# EAGLE schematic tpms_schema (EAGLE 9.6.2)
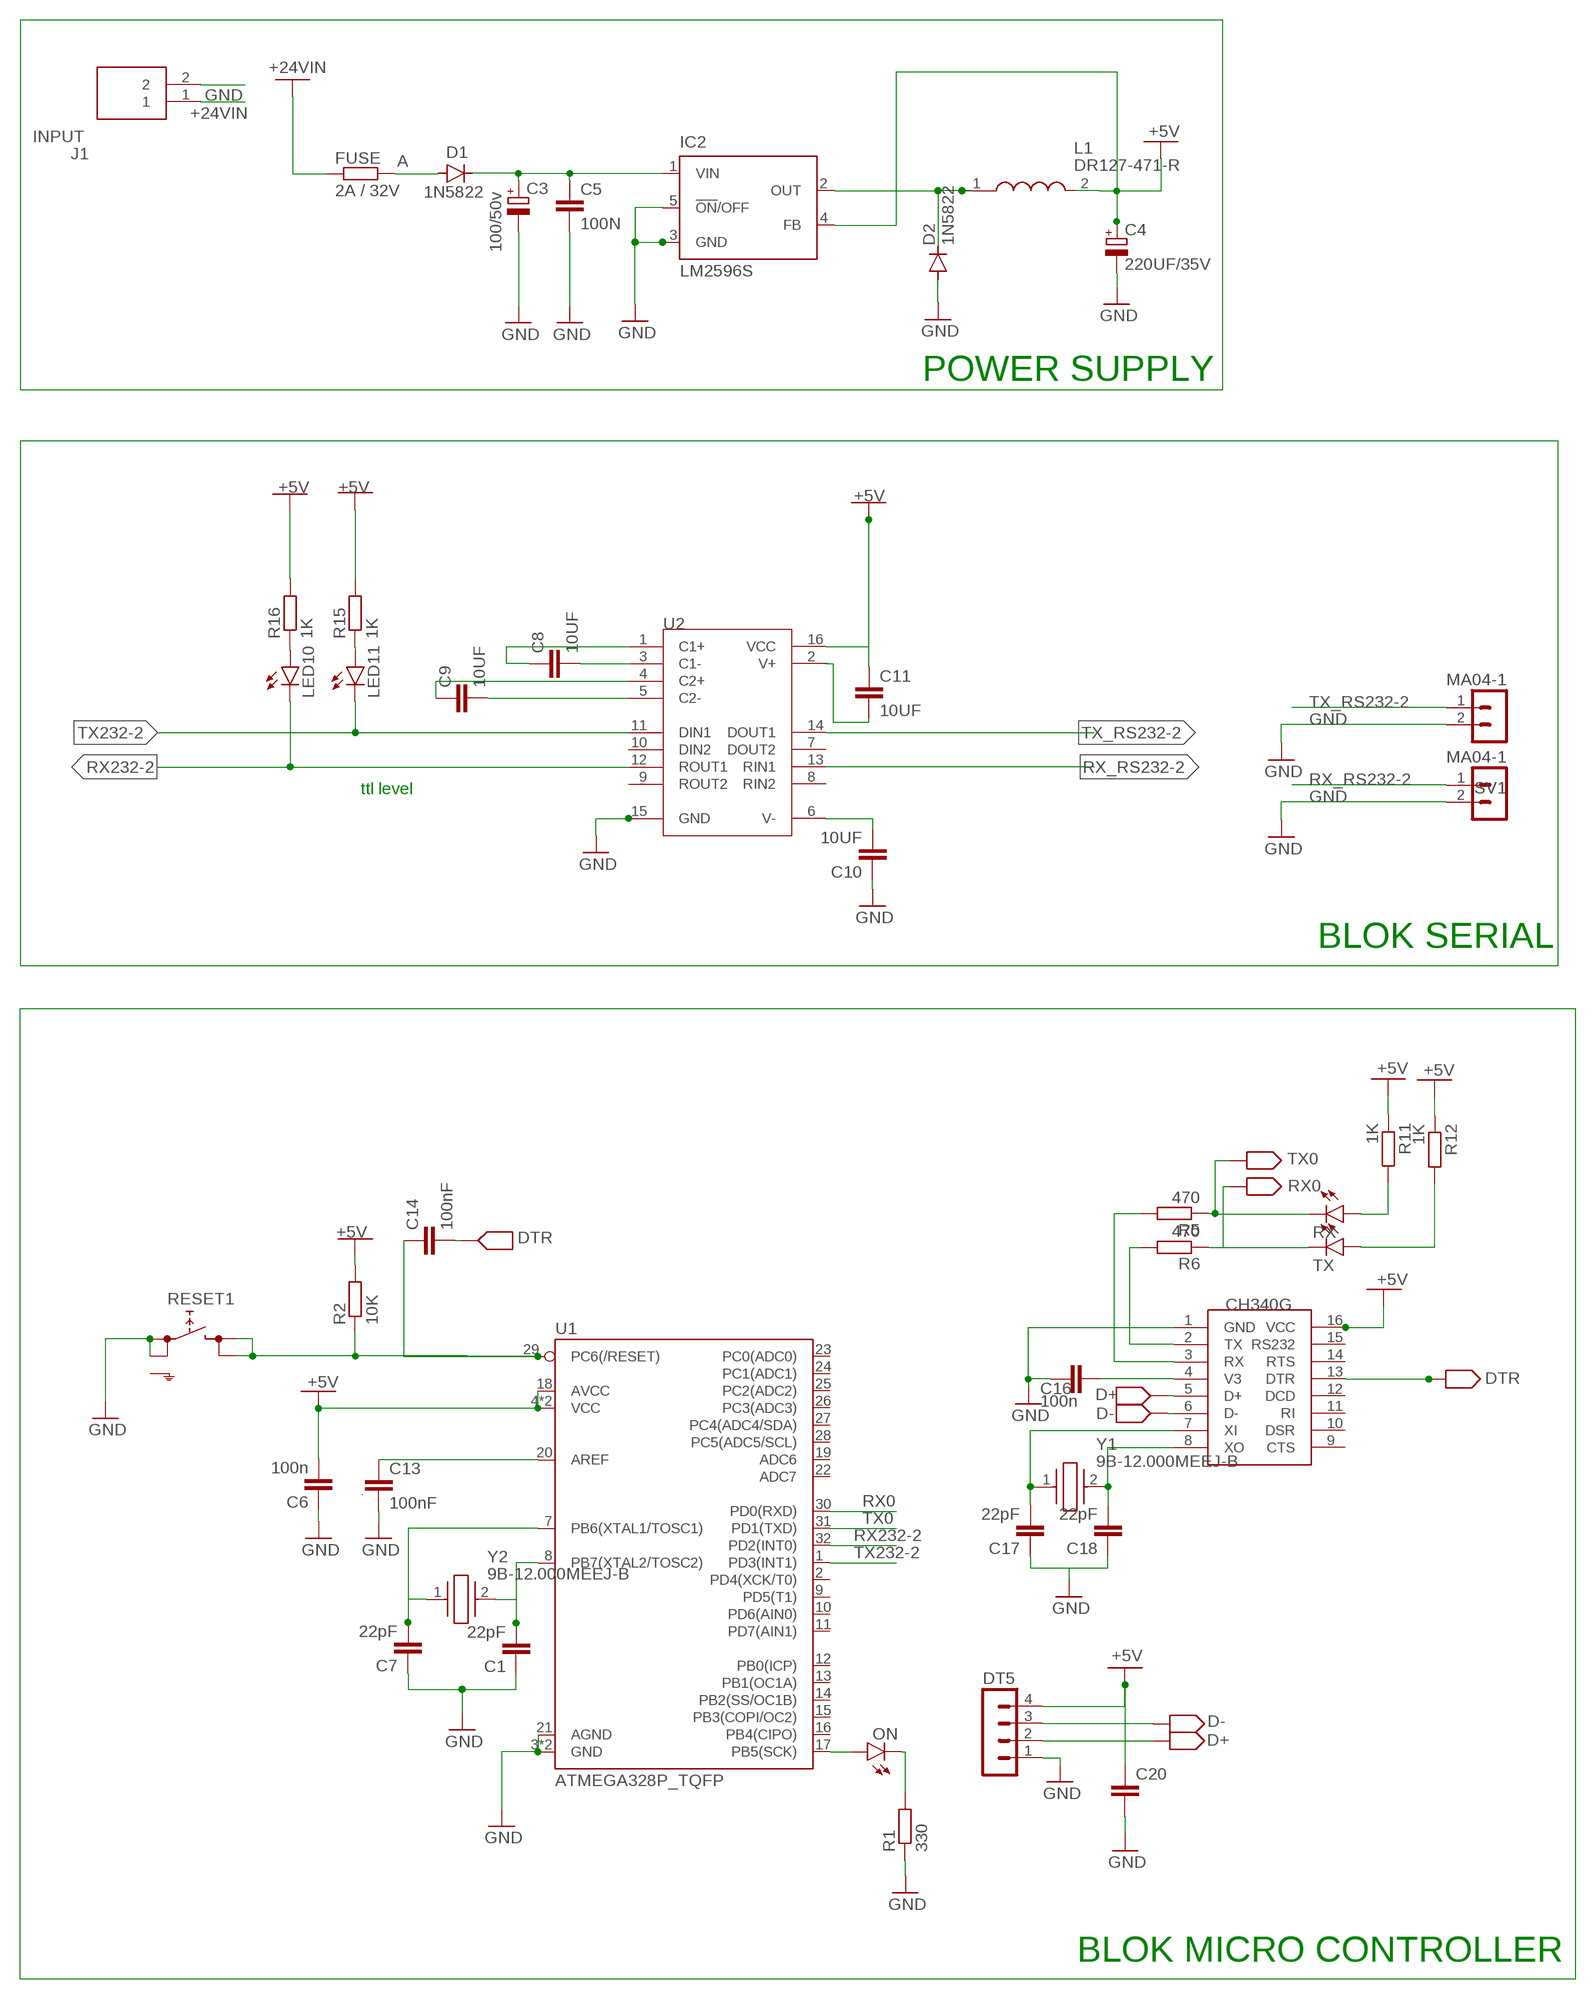
[diagram p0: schematic, sheet 1]

## Parts
C1  22pF  C-EUC0805  [C0805]
C3  100/50v  CPOL-EUG  [PANASONIC_G]
C4  220UF/35V  CPOL-EUG  [PANASONIC_G]
C5  100N  C-EUC0805  [C0805]
C6  100n  C-EUC0805  [C0805]
C7  22pF  C-EUC0805  [C0805]
C8  10UF  C-EUC0805  [C0805]
C9  10UF  C-EUC0805  [C0805]
C10  10UF  C-EUC0805  [C0805]
C11  10UF  C-EUC0805  [C0805]
C13  100nF  C-EUC0805  [C0805]
C14  100nF  C-EUC0805  [C0805]
C16  100n  C-EUC0805  [C0805]
C17  22pF  C-EUC0805  [C0805]
C18  22pF  C-EUC0805  [C0805]
C20  1uF  C-EUC0805  [C0805]
D1  1N5822  DIODE-MELF-MLL41  [MELF-MLL41]
D2  1N5822  DIODE-MELF-MLL41  [MELF-MLL41]
DT5  MA04-1  [MA04-1]
FUSE  2A / 32V  R-EU_R1206  [R1206]
IC2  LM2596S  [TO263-5]
J1  INPUT  691305330002  [691305330002]
L1  DR127-471-R  [INDPM125125X800N]
LED10  LEDCHIPLED_0805  [CHIPLED_0805]
LED11  LEDCHIPLED_0805  [CHIPLED_0805]
ON  LEDCHIP-LED0805  [CHIP-LED0805]
R1  330  R-EU_R0805  [R0805]
R2  10K  R-EU_R0805  [R0805]
R5  470  R-EU_R0805  [R0805]
R6  470  R-EU_R0805  [R0805]
R11  1K  R-EU_R0805  [R0805]
R12  1K  R-EU_R0805  [R0805]
R15  1K  R-EU_R0805  [R0805]
R16  1K  R-EU_R0805  [R0805]
RESET1  SKHMPSE010  [SKHMPXE010]
RX  LEDCHIP-LED0805  [CHIP-LED0805]
SV1  MA04-1  [MA04-1]
SV2  MA04-1  [MA04-1]
TX  LEDCHIP-LED0805  [CHIP-LED0805]
U1  ATMEGA328P_TQFP  [TQFP32-08]
U2  RF-MAX232D  [SOIC16-1.27-10X3.9MM]
U$1  CH340G  [SOIC16]
Y1  9B-12.000MEEJ-B  [9B12000MEEJB]
Y2  9B-12.000MEEJ-B  [9B12000MEEJB]

## Nets
+5V: C4.+ C6.2 C11.1 C20.1 DT5.4 IC2.4(FB) L1.2 R2.2 R11.1 R12.1 R15.2 R16.2 U1.4(VCC) U1.6(VCC) U1.18(AVCC) U2.16(VCC) U$1.16(VCC) ; supply symbol labelled -12V
+24VIN: FUSE.1 J1.1 ; supply symbol labelled -12V
A: D1.A FUSE.2
D+: DT5.2 U$1.5(D+) ; supply symbol labelled PORT_IN2, PORT_OUT2
D-: DT5.3 U$1.6(D-) ; supply symbol labelled PORT_IN2, PORT_OUT2
DTR: C14.2 U$1.13(DTR) ; supply symbol labelled PORT_OUT2, PORT_IN2
GND: C1.1 C3.- C4.- C5.2 C6.1 C7.1 C10.1 C13.2 C16.1 C17.1 C18.1 C20.2 D2.A DT5.1 IC2.3(GND) IC2.5(!ON!/OFF) J1.2 R1.1 RESET1.1(1.1) RESET1.2(1.2) SV1.2 SV2.2 U1.3(GND) U1.5(GND) U1.21(AGND) U2.15(GND) U$1.1(GND)
N$1: C9.2 U2.5(C2-)
N$2: C9.1 U2.4(C2+)
N$3: ON.A U1.17(PB5(SCK))
N$4: ON.C R1.2
N$5: C13.1 U1.20(AREF)
N$6: R11.2 RX.A
N$7: R12.2 TX.A
N$8: C16.2 U$1.4(V3)
N$10: C17.2 U$1.7(XI) Y1.1
N$11: C18.2 U$1.8(XO) Y1.2
N$13: R5.2 U$1.3(RX)
N$14: R6.2 U$1.2(TX)
N$16: LED10.A R16.1
N$18: C8.2 U2.3(C1-)
N$19: C8.1 U2.1(C1+)
N$21: D2.C IC2.2(OUT) L1.1
N$23: LED11.A R15.1
N$24: C10.2 U2.6(V-)
N$25: C11.2 U2.2(V+)
N$40: C3.+ C5.1 D1.C IC2.1(VIN)
PB6: C7.2 U1.7(PB6(XTAL1/TOSC1)) Y2.1
PB7: C1.2 U1.8(PB7(XTAL2/TOSC2)) Y2.2
RESET: C14.1 R2.1 RESET1.3(2.1) RESET1.4(2.2) U1.29(PC6(/RESET))
RX0: R6.1 TX.C U1.30(PD0(RXD)) ; supply symbol labelled PORT_OUT2
RX232-2: LED10.C U1.32(PD2(INT0)) U2.12(ROUT1)
RX_RS232-2: SV2.1 U2.13(RIN1)
TX0: R5.1 RX.C U1.31(PD1(TXD)) ; supply symbol labelled PORT_OUT2
TX232-2: LED11.C U1.1(PD3(INT1)) U2.11(DIN1)
TX_RS232-2: SV1.1 U2.14(DOUT1)
Unconnected: RESET1.5(SH) U1.2(PD4(XCK/T0)) U1.9(PD5(T1)) U1.10(PD6(AIN0)) U1.11(PD7(AIN1)) U1.12(PB0(ICP)) U1.13(PB1(OC1A)) U1.14(PB2(SS/OC1B)) U1.15(PB3(COPI/OC2)) U1.16(PB4(CIPO)) U1.19(ADC6) U1.22(ADC7) U1.23(PC0(ADC0)) U1.24(PC1(ADC1)) U1.25(PC2(ADC2)) U1.26(PC3(ADC3)) U1.27(PC4(ADC4/SDA)) U1.28(PC5(ADC5/SCL)) U2.7(DOUT2) U2.8(RIN2) U2.9(ROUT2) U2.10(DIN2) U$1.9(CTS) U$1.10(DSR) U$1.11(RI) U$1.12(DCD) U$1.14(RTS) U$1.15(RS232)

## Notes on the sheet
- POWER SUPPLY
- ttl level
- BLOK SERIAL
- BLOK MICRO CONTROLLER

## Library data of the parts
C1 C6-C11 C13 C14 C16-C18 C20 = rcl:C-EU: CAPACITOR, European symbol; SPICEPREFIX: C
C3 C4 = rcl:CPOL-EU: POLARIZED CAPACITOR, European symbol; SPICEPREFIX: C
C5 = resistor:C-EU: CAPACITOR, European symbol
D1 D2 = diode:DIODE-: DIODE
DT5 = JST 4 PIN PROGRAM:MA04-1: PIN HEADER; OC_FARNELL: unknown; OC_NEWARK: unknown
FUSE R1 R2 R5 R6 R11 R12 R15 R16 = rcl:R-EU_: RESISTOR, European symbol; SPICEPREFIX: R
IC2 = national-semiconductor:LM2596: SIMPLE SWITCHER® Power Converter 150 kHz 3A Step-Down Voltage Regulator Source: http://www.national.com/ds/LM/LM2596.pdf; MF: NATIONAL SEMICONDUCTOR; MPN: LM2596S-ADJ/NOPB; OC_FARNELL: 9494367; OC_NEWARK: 41K3842
J1 = PIN KONEKTOR 2:691305330002: Pluggable Terminal Blocks WR-TBL Md3053 3.81mm 2Pin Vtcl Hdr Source: Datasheet <https://katalog.we-online.de/em/datasheet/691305330002.pdf>; DESCRIPTION: Pluggable Terminal Blocks WR-TBL Md3053 3.81mm 2Pin Vtcl Hdr; HEIGHT: 9.5mm; MANUFACTURER_NAME: Wurth Elektronik; MANUFACTURER_PART_NUMBER: 691305330002; MOUSER_PART_NUMBER: 710-691305330002; MOUSER_PRICE-STOCK: https://www.mouser.co.uk/ProductDetail/Wurth-Elektronik/691305330002?qs=lBTPRtX1sU%252BM87DWQJO7mQ%3D%3D
L1 = DR127-471-R:DR127-471-R: Eaton Bussmann Series, DR73/74/125/127, 0127 Shielded Wire-wound SMD Inductor with a Ferrite Core, 470 uH +/-20% Source: Datasheet <https://www.eaton.com/content/dam/eaton/products/electronic-components/resources/data-sheet/eaton-dr-high-power-density-high-efficiency-shielded-drum-core-power-inductors-data-sheet.pdf>; ARROW_PART_NUMBER: DR127-471-R; ARROW_PRICE-STOCK: https://www.arrow.com/en/products/dr127-471-r/eaton?region=nac; DESCRIPTION: Eaton Bussmann Series, DR73/74/125/127, 0127 Shielded Wire-wound SMD Inductor with a Ferrite Core, 470 uH +/-20%; HEIGHT: 8mm; MANUFACTURER_NAME: Eaton; MANUFACTURER_PART_NUMBER: DR127-471-R; MOUSER_PART_NUMBER: 704-DR127-471-R; MOUSER_PRICE-STOCK: https://www.mouser.co.uk/ProductDetail/Coiltronics-Eaton/DR127-471-R?qs=yzwxPInThYQRgnstXp0%252BYA%3D%3D
LED10 LED11 ON RX TX = led:LED: LED OSRAM: - CHIPLED LG R971, LG N971, LY N971, LG Q971, LY Q971, LO R971, LY R971 LH N974, LH R974 LS Q976, LO Q976, LY Q976 LO Q996 - Hyper CHIPLED LW Q18S LB Q993, LB Q99A, LB R99A - SideLED LS A670, LO A670, LY A670, LG A670, LP A670 LB A673, LV A673, LT A673, LW A673 LH A674 LY A675 LS A676, LA A676, LO A676, LY A676, LW A676 LS A679, LY A679, LG A679 - Hyper Micro SIDELED® LS Y876, LA Y876, LO Y876, LY Y876 LT Y87S - SmartLED LW L88C, LW L88S LB L89C, LB L89S, LG L890 LS L89K, LO L89K, LY L89K LS L896, LA L896, LO L896, LY L896 - TOPLED LS T670, LO T670, LY T670, LG T670, LP T670 LSG T670, LSP T670, LSY T670, LOP T670, LYG T670 LG T671, LOG T671, LSG T671 LB T673, LV T673, LT T673, LW T673 LH T674 LS T676, LA T676, LO T676, LY T676, LB T676, LH T676, LSB T676, LW T676 LB T67C, LV T67C, LT T67C, LS T67K, LO T67K, LY T67K, LW E67C LS E67B, LA E67B, LO E67B, LY E67B, LB E67C, LV E67C, LT E67C LW T67C LS T679, LY T679, LG T679 LS T770, LO T770, LY T770, LG T770, LP T770 LB T773, LV T773, LT T773, LW T773 LH T774 LS E675, LA E675, LY E675, LS T675 LS T776, LA T776, LO T776, LY T776, LB T776 LHGB T686 LT T68C, LB T68C - Hyper Mini TOPLED® LB M676 - Mini TOPLED Santana® LG M470 LS M47K, LO M47K, LY M47K Source: http://www.osram.convergy.de LUXEON: - LUMILED® LXK2-PW12-R00, LXK2-PW12-S00, LXK2-PW14-U00, LXK2-PW14-V00 LXK2-PM12-R00, LXK2-PM12-S00, LXK2-PM14-U00 LXK2-PE12-Q00, LXK2-PE12-R00, LXK2-PE12-S00, LXK2-PE14-T00, LXK2-PE14-U00 LXK2-PB12-K00, LXK2-PB12-L00, LXK2-PB12-M00, LXK2-PB14-N00, LXK2-PB14-P00, LXK2-PB14-Q00 LXK2-PR12-L00, LXK2-PR12-M00, LXK2-PR14-Q00, LXK2-PR14-R00 LXK2-PD12-Q00, LXK2-PD12-R00, LXK2-PD12-S00 LXK2-PH12-R00, LXK2-PH12-S00 LXK2-PL12-P00, LXK2-PL12-Q00, LXK2-PL12-R00 Source: www.luxeon.com KINGBRIGHT: KA-3528ASYC Source: www.kingbright.com
RESET1 = switch:SKHMP*E010: 6.2 X 6.5mm TACT Switch (SMD) Source: http://www3.alps.co.jp/WebObjects/catalog.woa/PDF/E/Switch/Tact/SKHM/SKHM.PDF
SV1 SV2 = JST 2 PIN PROGRAM TIDUR:MA04-1: PIN HEADER; OC_FARNELL: unknown; OC_NEWARK: unknown
U1 = SparkFun-IC-Microcontroller:ATMEGA328P_TQFP: Popular 328P in QFP Storefront component: ATmega328 - TQFP <https://www.sparkfun.com/products/13448> (COM-13448) Datasheet <http://www.sparkfun.com/datasheets/Components/SMD/ATMega328.pdf> SparkFun Products SparkFun RedBoard - Programmed with Arduino <https://www.sparkfun.com/products/12757> (DEV-12757) Arduino Pro Mini 328 - 5V/16MHz <https://www.sparkfun.com/products/11113> (DEV-11113) Arduino Pro Mini 328 - 3.3V/8MHz <https://www.sparkfun.com/products/11114> (DEV-11114) SparkFun OpenLog <https://www.sparkfun.com/products/13712> (DEV-13712) SparkFun MicroView - OLED Arduino Module <https://www.sparkfun.com/products/12923> (DEV-12923) SparkFun Digital Sandbox <https://www.sparkfun.com/products/12651> (DEV-12651) SparkFun PicoBoard <https://www.sparkfun.com/products/11888> (WIG-11888) Arduino Fio <https://www.sparkfun.com/products/10116> (DEV-10116) LilyPad Arduino 328 Main Board <https://www.sparkfun.com/products/13342> (DEV-13342) SparkFun RedStick <https://www.sparkfun.com/products/13741> (DEV-13741) LilyPad MP3 <https://www.sparkfun.com/products/11013> (DEV-11013) LilyPad Arduino SimpleSnap <https://www.sparkfun.com/products/10941> (DEV-10941) SparkFun Stepoko <https://www.sparkfun.com/products/13899> (ROB-13899) SparkFun Geiger Counter <https://www.sparkfun.com/products/11345> (SEN-11345) SparkFun EL Sequencer <https://www.sparkfun.com/products/12781> (COM-12781) Arduino Pro 328 - 5V/16MHz <https://www.sparkfun.com/products/10915> (DEV-10915) CryptoCape <https://www.sparkfun.com/products/12773> (DEV-12773) SparkFun IR Thermometer Evaluation Board - MLX90614 <https://www.sparkfun.com/products/10740> (SEN-10740) SparkFun RedBot Mainboard <https://www.sparkfun.com/products/12097> (ROB-12097) Arduino Pro 328 - 3.3V/8MHz <https://www.sparkfun.com/products/10914> (DEV-10914) SparkFun Block for Intel® Edison - Arduino <https://www.sparkfun.com/products/13036> (DEV-13036) SparkFun Simon Says - Surface Mount Soldering Kit <https://www.sparkfun.com/products/10935> (KIT-10935) SparkFun 7-Segment Serial Display - Red <https://www.sparkfun.com/products/11441> (COM-11441) SparkFun 7-Segment Serial Display - White <https://www.sparkfun.com/products/11629> (COM-11629) SparkFun 7-Segment Serial Display - Yellow <https://www.sparkfun.com/products/11443> (COM-11443) SparkFun 7-Segment Serial Display - Kelly Green <https://www.sparkfun.com/products/11440> (COM-11440) SparkFun 7-Segment Serial Display - Blue <https://www.sparkfun.com/products/11442> (COM-11442) SparkFun OpenSegment Serial Display - 20mm (Blue) <https://www.sparkfun.com/products/11647> (COM-11647) SparkFun OpenSegment Serial Display - 20mm (Green) <https://www.sparkfun.com/products/11646> (COM-11646) SparkFun OpenSegment Serial Display - 20mm (White) <https://www.sparkfun.com/products/11648> (COM-11648) SparkFun OpenSegment Serial Display - 20mm (Red) <https://www.sparkfun.com/products/11644> (COM-11644) SparkFun OpenSegment Serial Display - 20mm (Yellow) <https://www.sparkfun.com/products/11645> (COM-11645) SparkFun OpenSegment Shield <https://www.sparkfun.com/products/13190> (DEV-13190); PROD_ID: IC-09069
U2 = RS232:RF-MAX232D: 310060023
U$1 = ch340g:CH340G
Y1 Y2 = 9B-12.000MEEJ-B:9B-12.000MEEJ-B: Crystal 12MHz +/-10ppm (Tol) +/-10ppm (Stability) 18pF FUND 40Ohm 2-Pin DIP HC-49/S Thru-Hole Bulk Source: Datasheet <https://componentsearchengine.com/Datasheets/2/9B-12.000MEEJ-B.pdf>; ARROW_PART_NUMBER: 9B-12.000MEEJ-B; ARROW_PRICE-STOCK: https://www.arrow.com/en/products/9b-12.000meej-b/txc-corporation; DESCRIPTION: Crystal 12MHz +/-10ppm (Tol) +/-10ppm (Stability) 18pF FUND 40Ohm 2-Pin DIP HC-49/S Thru-Hole Bulk; HEIGHT: 3.68mm; MANUFACTURER_NAME: TXC; MANUFACTURER_PART_NUMBER: 9B-12.000MEEJ-B; MOUSER_PART_NUMBER: 717-9B-12.000MEEJ-B; MOUSER_PRICE-STOCK: https://www.mouser.co.uk/ProductDetail/TXC-Corporation/9B-12000MEEJ-B?qs=65dIHZNch5vzq4KW6yYwYA%3D%3D